# Altium schematic sheet Sheet_1_2026-10-10 (1).schdoc
size 212 x 196 mm
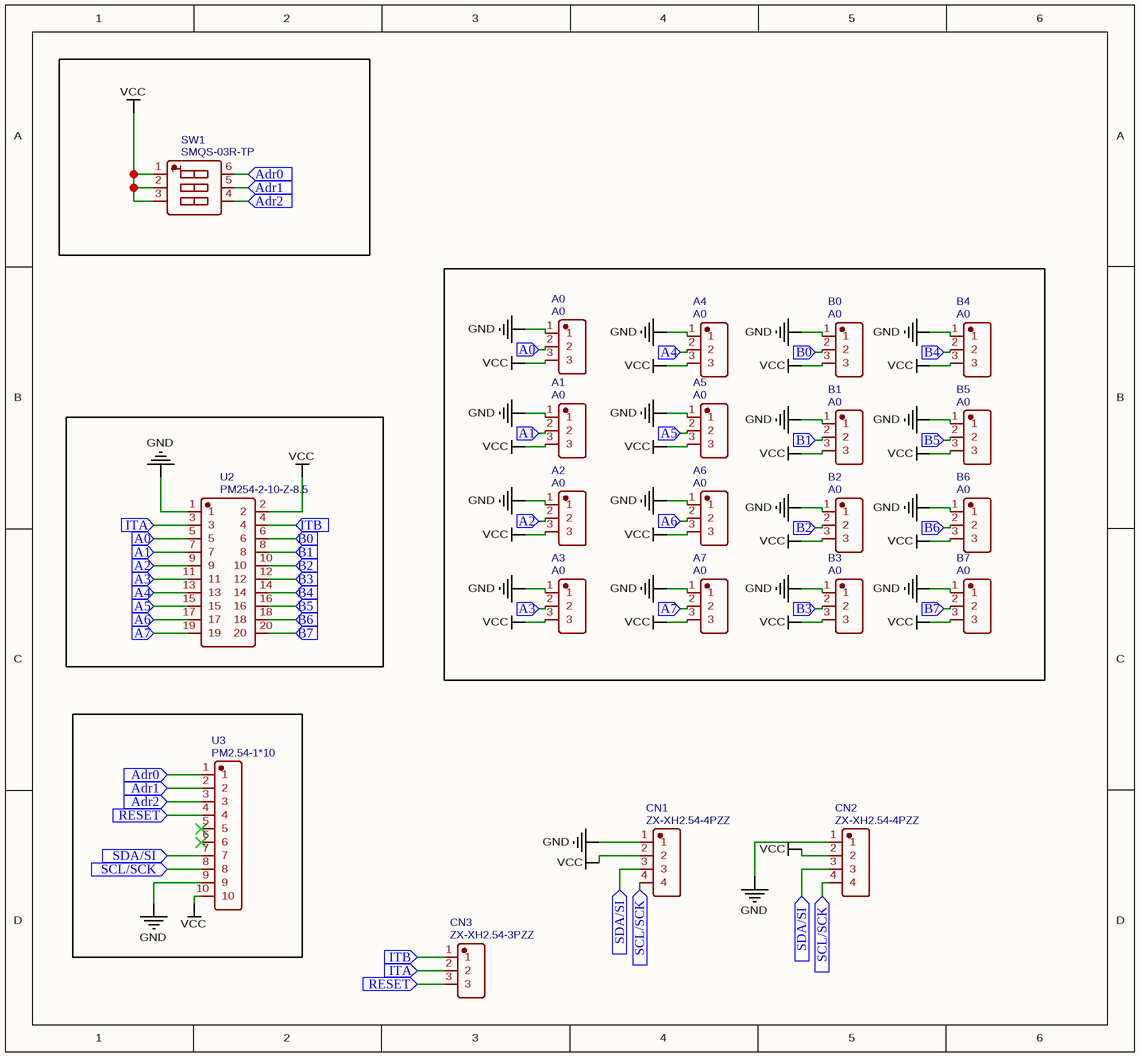
[diagram p0: Sheet_1_2026-10-10 (1).schdoc]

## Parts
A0  A0  [CONN-TH_MX2EDGVC-2.54-03P-GN01-CU-A]
A1  A0  [CONN-TH_MX2EDGVC-2.54-03P-GN01-CU-A]
A2  A0  [CONN-TH_MX2EDGVC-2.54-03P-GN01-CU-A]
A3  A0  [CONN-TH_MX2EDGVC-2.54-03P-GN01-CU-A]
A4  A0  [CONN-TH_MX2EDGVC-2.54-03P-GN01-CU-A]
A5  A0  [CONN-TH_MX2EDGVC-2.54-03P-GN01-CU-A]
A6  A0  [CONN-TH_MX2EDGVC-2.54-03P-GN01-CU-A]
A7  A0  [CONN-TH_MX2EDGVC-2.54-03P-GN01-CU-A]
B0  A0  [CONN-TH_MX2EDGVC-2.54-03P-GN01-CU-A]
B1  A0  [CONN-TH_MX2EDGVC-2.54-03P-GN01-CU-A]
B2  A0  [CONN-TH_MX2EDGVC-2.54-03P-GN01-CU-A]
B3  A0  [CONN-TH_MX2EDGVC-2.54-03P-GN01-CU-A]
B4  A0  [CONN-TH_MX2EDGVC-2.54-03P-GN01-CU-A]
B5  A0  [CONN-TH_MX2EDGVC-2.54-03P-GN01-CU-A]
B6  A0  [CONN-TH_MX2EDGVC-2.54-03P-GN01-CU-A]
B7  A0  [CONN-TH_MX2EDGVC-2.54-03P-GN01-CU-A]
CN1  ZX-XH2.54-4PZZ  [CONN-TH_4P-P2.50_4PIN]
CN2  ZX-XH2.54-4PZZ  [CONN-TH_4P-P2.50_4PIN]
CN3  ZX-XH2.54-3PZZ  [CONN-TH_3P-P2.54_2501S-3P]
SW1  SMQS-03R-TP  [SW-TH_SMQS-03B-TP]
U2  PM254-2-10-Z-8.5  [HDR-TH_20P-P2.54-V-F-R2-C10-S2.54]
U3  PM2.54-1*10  [HDR-TH_10P-P2.54-V-F]

## Ports
A0 (in), A1 (in), A2 (in), A3 (in), A4 (in), A5 (in), A6 (in), A7 (in), Adr0 (in), Adr1 (in), Adr2 (in), B0 (in), B1 (in), B2 (in), B3 (in), B4 (in), B5 (in), B6 (in), B7 (in), ITA (in), ITB (in), RESET (in), SCL/SCK (in), SDA/SI (in)

## Nets
GND: A0.1 A1.1 A2.1 A3.1 A4.1 A5.1 A6.1 A7.1 B0.1 B1.1 B2.1 B3.1 B4.1 B5.1 B6.1 B7.1 CN1.1 CN2.1 U2.1 U3.9
VCC: A0.3 A1.3 A2.3 A3.3 A4.3 A5.3 A6.3 A7.3 B0.3 B1.3 B2.3 B3.3 B4.3 B5.3 B6.3 B7.3 CN1.2 CN2.2 SW1.1 SW1.2 SW1.3 U2.2 U3.10
A0: A0.2 U2.5 ; port A0
A1: A1.2 U2.7 ; port A1
A2: A2.2 U2.9 ; port A2
A3: A3.2 U2.11 ; port A3
A4: A4.2 U2.13 ; port A4
A5: A5.2 U2.15 ; port A5
A6: A6.2 U2.17 ; port A6
A7: A7.2 U2.19 ; port A7
Adr0: SW1.6 U3.1 ; port Adr0
Adr1: SW1.5 U3.2 ; port Adr1
Adr2: SW1.4 U3.3 ; port Adr2
B0: B0.2 U2.6 ; port B0
B1: B1.2 U2.8 ; port B1
B2: B2.2 U2.10 ; port B2
B3: B3.2 U2.12 ; port B3
B4: B4.2 U2.14 ; port B4
B5: B5.2 U2.16 ; port B5
B6: B6.2 U2.18 ; port B6
B7: B7.2 U2.20 ; port B7
ITA: CN3.2 U2.3 ; port ITA
ITB: CN3.1 U2.4 ; port ITB
RESET: CN3.3 U3.4 ; port RESET
SCL/SCK: CN1.4 CN2.4 U3.8 ; port SCL/SCK
SDA/SI: CN1.3 CN2.3 U3.7 ; port SDA/SI

Not connected (* = marked no-connect by the designer): U3 5* 6*

## Library data of the parts
A0-A7 B0-B7 = A0: Manufacturer: MAX(迈旭); Manufacturer Part: MX2EDGVC-2.54-03P-GN01-Cu-A; Contributor: lcsc; Supplier: LCSC; Supplier Part: C5290419; JLCPCB Part Class: Extended Part; spicePre: C; spiceSymbolName: MX2EDGVC-2.54-03P-GN01-CU-A
CN1 CN2 = ZX-XH2.54-4PZZ: Manufacturer: Megastar(兆星); Contributor: lcsc; Supplier: LCSC; Supplier Part: C7429634; Manufacturer Part: ZX-XH2.54-4PZZ; JLCPCB Part Class: Extended Part; spicePre: C; spiceSymbolName: ZX-XH2.54-4PZZ
CN3 = ZX-XH2.54-3PZZ: Manufacturer: Megastar(兆星); Contributor: lcsc; Supplier: LCSC; Supplier Part: C7429633; Manufacturer Part: ZX-XH2.54-3PZZ; JLCPCB Part Class: Extended Part; spicePre: C; spiceSymbolName: ZX-XH2.54-3PZZ
SW1 = SMQS-03R-TP: Manufacturer: SM Switch; Contributor: lcsc; Supplier: LCSC; Supplier Part: C5299504; Manufacturer Part: SMQS-03R-TP; spicePre: S; spiceSymbolName: SMQS-03R-TP
U2 = PM254-2-10-Z-8.5: Manufacturer: HCTL(华灿天禄); Contributor: LCSC; Supplier: LCSC; Supplier Part: C2897411; Manufacturer Part: PM254-2-10-Z-8.5; JLCPCB Part Class: Extended Part; spicePre: U; spiceSymbolName: PM254-2-10-Z-8.5
U3 = PM2.54-1*10: Manufacturer: ZHOURI(洲日); Contributor: lcsc; Supplier: LCSC; Supplier Part: C5116489; Manufacturer Part: PM2.54-1*10; JLCPCB Part Class: Extended Part; spicePre: U; spiceSymbolName: PM2.54-1*10